# Altium schematic sheet FPGA_breadboard_connections.SchDoc
size A3; SheetNumber: 4; SheetTotal: 15
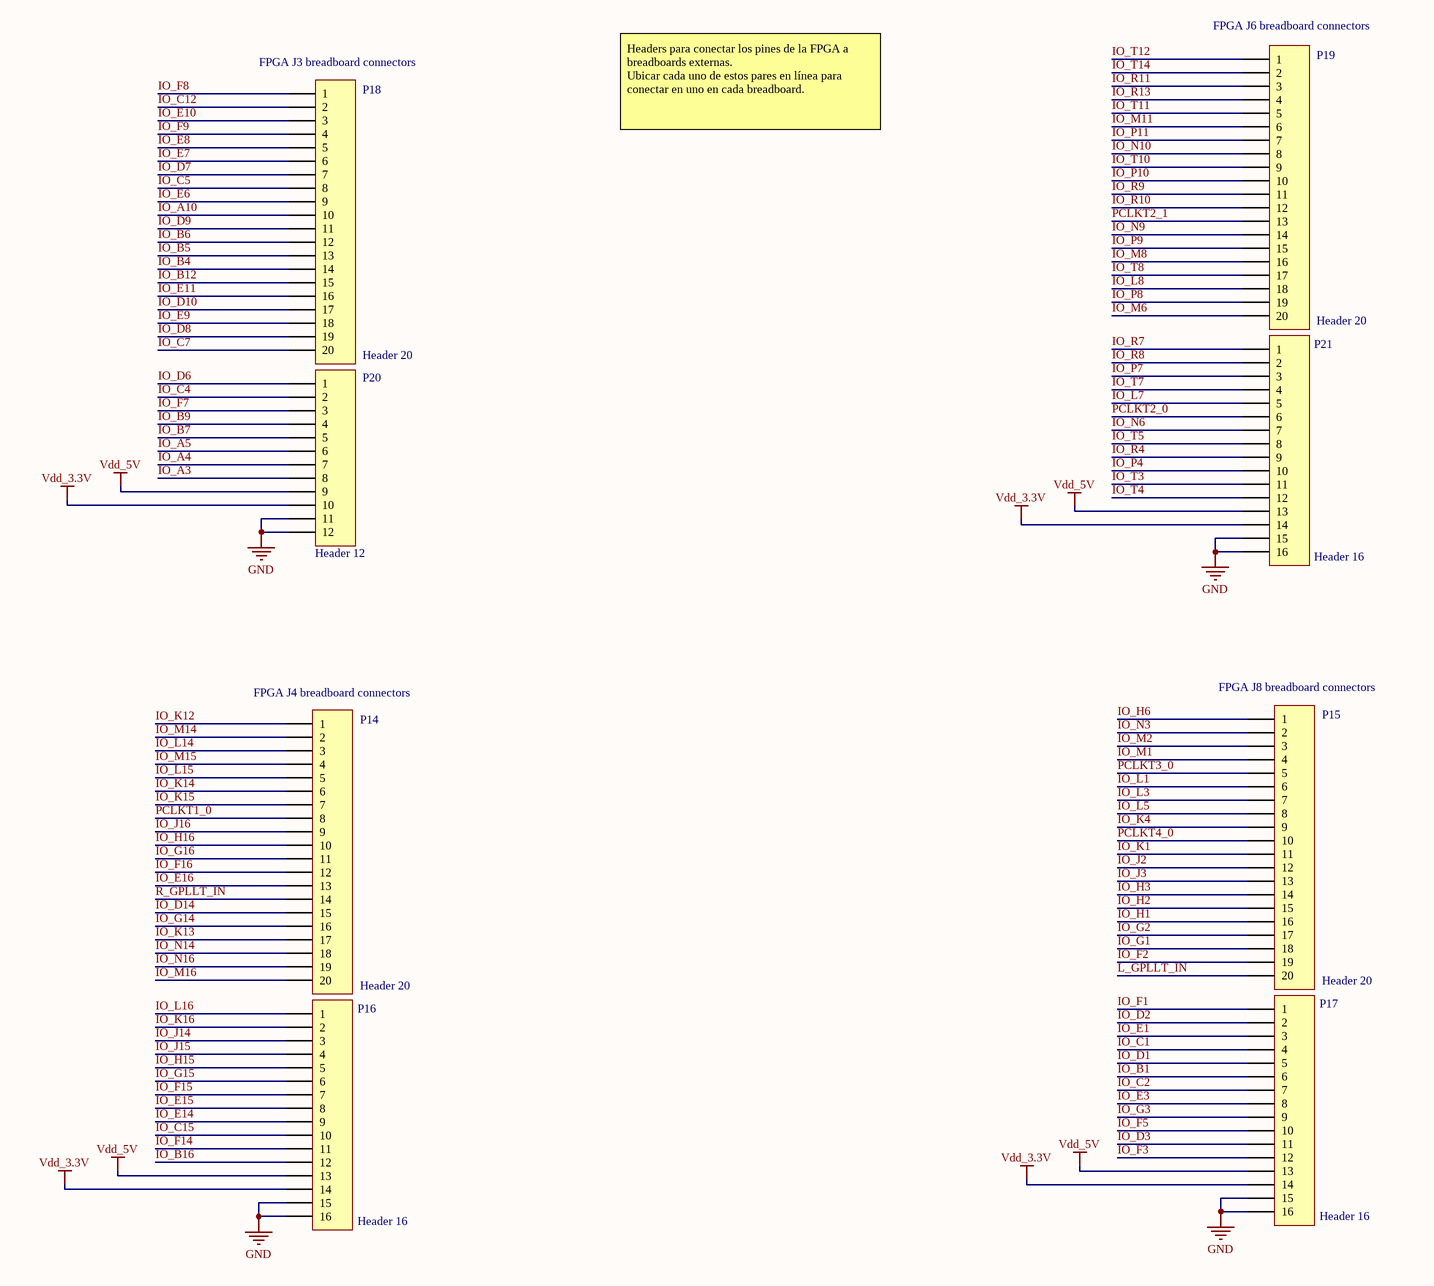
[diagram p0: FPGA_breadboard_connections.SchDoc]

## Parts
P14  Header 20  [HDR1X20]
P15  Header 20  [HDR1X20]
P16  Header 16  [HDR1X16]
P17  Header 16  [HDR1X16]
P18  Header 20  [HDR1X20]
P19  Header 20  [HDR1X20]
P20  Header 12  [HDR1X12]
P21  Header 16  [HDR1X16]

## Nets
GND: P16.15 P16.16 P17.15 P17.16 P20.11 P20.12 P21.15 P21.16
Vdd_3.3V: P16.14 P17.14 P20.10 P21.14
Vdd_5V: P16.13 P17.13 P20.9 P21.13
IO_A3: P20.8
IO_A4: P20.7
IO_A5: P20.6
IO_A10: P18.10
IO_B1: P17.6
IO_B4: P18.14
IO_B5: P18.13
IO_B6: P18.12
IO_B7: P20.5
IO_B9: P20.4
IO_B12: P18.15
IO_B16: P16.12
IO_C1: P17.4
IO_C2: P17.7
IO_C4: P20.2
IO_C5: P18.8
IO_C7: P18.20
IO_C12: P18.2
IO_C15: P16.10
IO_D1: P17.5
IO_D2: P17.2
IO_D3: P17.11
IO_D6: P20.1
IO_D7: P18.7
IO_D8: P18.19
IO_D9: P18.11
IO_D10: P18.17
IO_D14: P14.15
IO_E1: P17.3
IO_E3: P17.8
IO_E6: P18.9
IO_E7: P18.6
IO_E8: P18.5
IO_E9: P18.18
IO_E10: P18.3
IO_E11: P18.16
IO_E14: P16.9
IO_E15: P16.8
IO_E16: P14.13
IO_F1: P17.1
IO_F2: P15.19
IO_F3: P17.12
IO_F5: P17.10
IO_F7: P20.3
IO_F8: P18.1
IO_F9: P18.4
IO_F14: P16.11
IO_F15: P16.7
IO_F16: P14.12
IO_G1: P15.18
IO_G2: P15.17
IO_G3: P17.9
IO_G14: P14.16
IO_G15: P16.6
IO_G16: P14.11
IO_H1: P15.16
IO_H2: P15.15
IO_H3: P15.14
IO_H6: P15.1
IO_H15: P16.5
IO_H16: P14.10
IO_J2: P15.12
IO_J3: P15.13
IO_J14: P16.3
IO_J15: P16.4
IO_J16: P14.9
IO_K1: P15.11
IO_K4: P15.9
IO_K12: P14.1
IO_K13: P14.17
IO_K14: P14.6
IO_K15: P14.7
IO_K16: P16.2
IO_L1: P15.6
IO_L3: P15.7
IO_L5: P15.8
IO_L7: P21.5
IO_L8: P19.18
IO_L14: P14.3
IO_L15: P14.5
IO_L16: P16.1
IO_M1: P15.4
IO_M2: P15.3
IO_M6: P19.20
IO_M8: P19.16
IO_M11: P19.6
IO_M14: P14.2
IO_M15: P14.4
IO_M16: P14.20
IO_N3: P15.2
IO_N6: P21.7
IO_N9: P19.14
IO_N10: P19.8
IO_N14: P14.18
IO_N16: P14.19
IO_P4: P21.10
IO_P7: P21.3
IO_P8: P19.19
IO_P9: P19.15
IO_P10: P19.10
IO_P11: P19.7
IO_R4: P21.9
IO_R7: P21.1
IO_R8: P21.2
IO_R9: P19.11
IO_R10: P19.12
IO_R11: P19.3
IO_R13: P19.4
IO_T3: P21.11
IO_T4: P21.12
IO_T5: P21.8
IO_T7: P21.4
IO_T8: P19.17
IO_T10: P19.9
IO_T11: P19.5
IO_T12: P19.1
IO_T14: P19.2
L_GPLLT_IN: P15.20
PCLKT1_0: P14.8
PCLKT2_0: P21.6
PCLKT2_1: P19.13
PCLKT3_0: P15.5
PCLKT4_0: P15.10
R_GPLLT_IN: P14.14

## Notes on the sheet
- (near P19) FPGA J6 breadboard connectors
- (near P18) FPGA J3 breadboard connectors
- Headers para conectar los pines de la FPGA a breadboards externas.
  Ubicar cada uno de estos pares en línea para conectar en uno en cada breadboard.
- (near P14) FPGA J4 breadboard connectors
- (near P15) FPGA J8 breadboard connectors

## Library data of the parts
P14 P15 P18 P19 = Header 20: Header, 20-Pin; LatestRevisionDate: 17-Jul-2002; LatestRevisionNote: Re-released for DXP Platform.; Publisher: Altium Limited
P16 P17 P21 = Header 16: Header, 16-Pin; LatestRevisionDate: 17-Jul-2002; LatestRevisionNote: Re-released for DXP Platform.; Publisher: Altium Limited
P20 = Header 12: Header, 12-Pin; LatestRevisionDate: 17-Jul-2002; LatestRevisionNote: Re-released for DXP Platform.; Publisher: Altium Limited